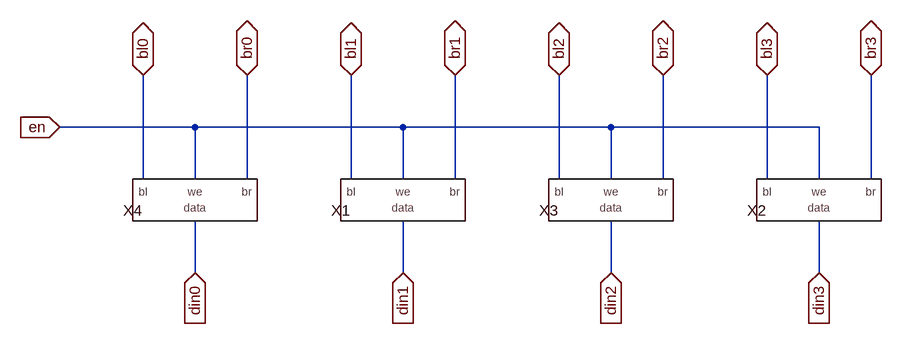
[diagram p0: schematic write_driver_array.asc]
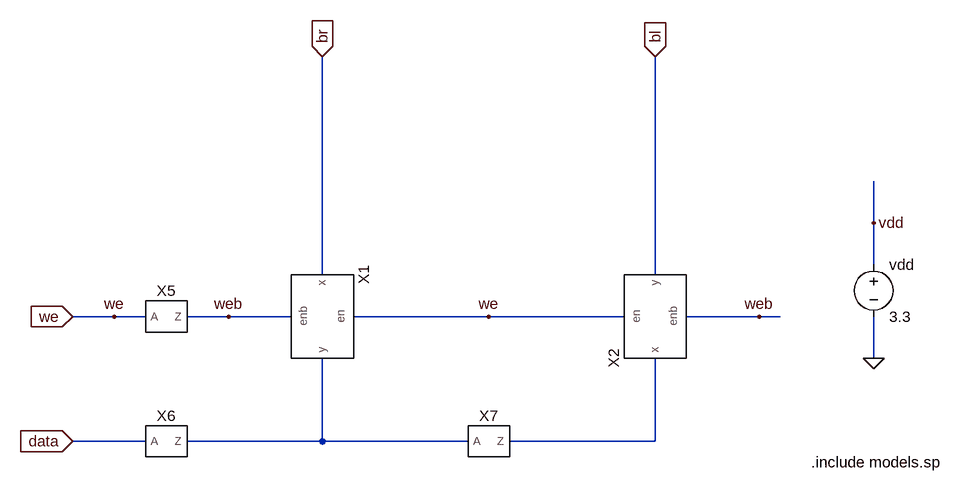
[diagram p1: sub-circuit write_driver.asc]
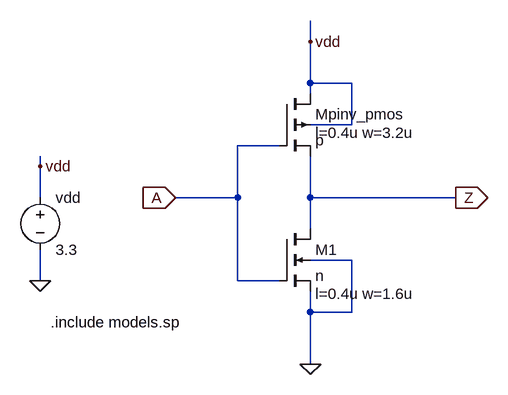
[diagram p2: sub-circuit inv.asc]
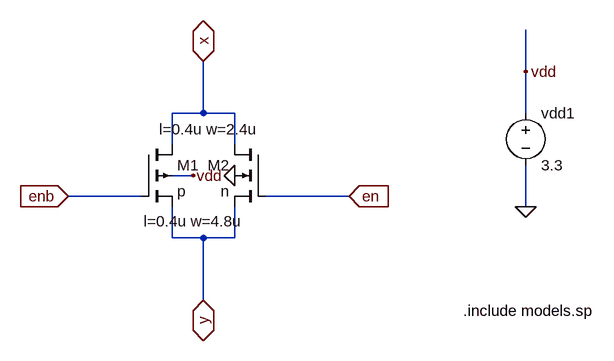
[diagram p3: sub-circuit tri_gate.asc]
write_driver_array.asc, the LTspice schematic file:
Version 4
SHEET 1 880 680
WIRE -256 32 -464 32
WIRE 64 32 -256 32
WIRE 384 32 64 32
WIRE 704 32 384 32
WIRE -336 112 -336 -48
WIRE -256 112 -256 32
WIRE -176 112 -176 -48
WIRE -16 112 -16 -48
WIRE 64 112 64 32
WIRE 144 112 144 -48
WIRE 304 112 304 -48
WIRE 384 112 384 32
WIRE 464 112 464 -48
WIRE 624 112 624 -48
WIRE 704 112 704 32
WIRE 784 112 784 -48
WIRE -256 256 -256 176
WIRE 64 256 64 176
WIRE 384 256 384 176
WIRE 704 256 704 176
FLAG -336 -48 bl0
IOPIN -336 -48 BiDir
FLAG -176 -48 br0
IOPIN -176 -48 BiDir
FLAG -16 -48 bl1
IOPIN -16 -48 BiDir
FLAG 144 -48 br1
IOPIN 144 -48 BiDir
FLAG 304 -48 bl2
IOPIN 304 -48 BiDir
FLAG 464 -48 br2
IOPIN 464 -48 BiDir
FLAG 624 -48 bl3
IOPIN 624 -48 BiDir
FLAG 784 -48 br3
IOPIN 784 -48 BiDir
FLAG -256 256 din0
IOPIN -256 256 In
FLAG 64 256 din1
IOPIN 64 256 In
FLAG 384 256 din2
IOPIN 384 256 In
FLAG 704 256 din3
IOPIN 704 256 In
FLAG -464 32 en
IOPIN -464 32 In
SYMBOL write_driver 64 144 R0
SYMATTR InstName X1
SYMBOL write_driver 704 144 R0
SYMATTR InstName X2
SYMBOL write_driver 384 144 R0
SYMATTR InstName X3
SYMBOL write_driver -256 144 R0
SYMATTR InstName X4

write_driver.asc, the sub-circuit schematic file:
Version 4
SHEET 1 880 680
WIRE 624 -624 624 -688
WIRE 624 -560 624 -624
WIRE -224 -544 -224 -880
WIRE 288 -544 288 -880
WIRE -544 -480 -608 -480
WIRE -496 -480 -544 -480
WIRE -368 -480 -432 -480
WIRE -272 -480 -368 -480
WIRE 32 -480 -176 -480
WIRE 240 -480 32 -480
WIRE 448 -480 336 -480
WIRE 480 -480 448 -480
WIRE 624 -416 624 -480
WIRE -496 -288 -608 -288
WIRE -224 -288 -224 -416
WIRE -224 -288 -432 -288
WIRE 0 -288 -224 -288
WIRE 288 -288 288 -416
WIRE 288 -288 64 -288
FLAG 624 -416 0
FLAG 624 -624 vdd
FLAG -608 -480 we
IOPIN -608 -480 In
FLAG -608 -288 data
IOPIN -608 -288 In
FLAG -224 -880 br
IOPIN -224 -880 In
FLAG 288 -880 bl
IOPIN 288 -880 In
FLAG -368 -480 web
FLAG 32 -480 we
FLAG -544 -480 we
FLAG 448 -480 web
SYMBOL voltage 624 -576 R0
WINDOW 123 0 0 Left 0
WINDOW 39 0 0 Left 0
SYMATTR InstName vdd
SYMATTR Value 3.3
SYMBOL inv -464 -480 R0
SYMATTR InstName X5
SYMBOL inv -464 -288 R0
SYMATTR InstName X6
SYMBOL inv 32 -288 R0
SYMATTR InstName X7
SYMBOL tri_gate -224 -480 R90
SYMATTR InstName X1
SYMBOL tri_gate 288 -480 R270
SYMATTR InstName X2
TEXT 528 -256 Left 2 !.include models.sp

inv.asc, the sub-circuit schematic file:
Version 4
SHEET 1 880 680
WIRE 112 -128 112 -160
WIRE 112 -64 112 -128
WIRE 176 -64 112 -64
WIRE 112 -48 112 -64
WIRE 176 0 176 -64
WIRE 176 0 112 0
WIRE 64 32 0 32
WIRE -304 64 -304 48
WIRE -304 112 -304 64
WIRE 0 112 0 32
WIRE 0 112 -96 112
WIRE 112 112 112 48
WIRE 336 112 112 112
WIRE 112 160 112 112
WIRE 176 208 112 208
WIRE -304 240 -304 192
WIRE 0 240 0 112
WIRE 64 240 0 240
WIRE 112 288 112 256
WIRE 176 288 176 208
WIRE 176 288 112 288
WIRE 112 368 112 288
FLAG -96 112 A
IOPIN -96 112 In
FLAG 336 112 Z
IOPIN 336 112 Out
FLAG 112 368 0
FLAG -304 240 0
FLAG 112 -128 vdd
FLAG -304 64 vdd
SYMBOL nmos4 64 160 R0
WINDOW 123 56 100 Left 2
SYMATTR Value2 l=0.4u w=1.6u
SYMATTR InstName M1
SYMATTR Value n
SYMBOL pmos4 64 -48 R0
WINDOW 123 56 60 Left 2
SYMATTR Value2 l=0.4u w=3.2u
SYMATTR InstName Mpinv_pmos
SYMATTR Value p
SYMBOL voltage -304 96 R0
SYMATTR InstName vdd
SYMATTR Value 3.3
TEXT -288 304 Left 2 !.include models.sp

tri_gate.asc, the sub-circuit schematic file:
Version 4
SHEET 1 880 680
WIRE 576 -16 576 -80
WIRE 80 48 80 -32
WIRE 80 48 32 48
WIRE 128 48 80 48
WIRE 576 48 576 -16
WIRE 32 96 32 48
WIRE 128 96 128 48
WIRE 64 144 32 144
WIRE -16 176 -128 176
WIRE 304 176 176 176
WIRE 576 192 576 128
WIRE 32 240 32 192
WIRE 80 240 32 240
WIRE 128 240 128 192
WIRE 128 240 80 240
WIRE 80 336 80 240
FLAG 128 144 0
FLAG 64 144 vdd
FLAG 576 192 0
FLAG 576 -16 vdd
FLAG 80 336 y
IOPIN 80 336 BiDir
FLAG 80 -32 x
IOPIN 80 -32 BiDir
FLAG 304 176 en
IOPIN 304 176 In
FLAG -128 176 enb
IOPIN -128 176 In
SYMBOL pmos4 -16 96 R0
WINDOW 123 4 118 Left 2
SYMATTR Value2 l=0.4u w=4.8u
SYMATTR InstName M1
SYMATTR Value p
SYMBOL nmos4 176 96 M0
WINDOW 123 12 -23 Left 2
SYMATTR Value2 l=0.4u w=2.4u
SYMATTR InstName M2
SYMATTR Value n
SYMBOL voltage 576 32 R0
WINDOW 123 0 0 Left 0
WINDOW 39 0 0 Left 0
SYMATTR InstName vdd1
SYMATTR Value 3.3
TEXT 480 352 Left 2 !.include models.sp

The netlist it stands for:
* write_driver_array.asc
XX1 bl1 br1 din1 en write_driver
XX2 bl3 br3 din3 en write_driver
XX3 bl2 br2 din2 en write_driver
XX4 bl0 br0 din0 en write_driver

* block symbol definitions
.subckt write_driver bl br data we
vdd vdd 0 3.3
XX5 we web inv
XX6 data N001 inv
XX7 N001 N002 inv
XX1 we web br N001 tri_gate
XX2 we web N002 bl tri_gate
.include models.sp
.ends write_driver

.subckt inv A Z
M1 Z A 0 0 n l=0.4u w=1.6u
Mpinv_pmos vdd A Z vdd p l=0.4u w=3.2u
vdd vdd 0 3.3
.include models.sp
.ends inv

.subckt tri_gate en enb x y
M1 x enb y vdd p l=0.4u w=4.8u
M2 x en y 0 n l=0.4u w=2.4u
vdd1 vdd 0 3.3
.include models.sp
.ends tri_gate

.model NMOS NMOS
.model PMOS PMOS
.lib standard.mos
.backanno
.end